# EAGLE design rear-port-power (EAGLE 9.7.0)
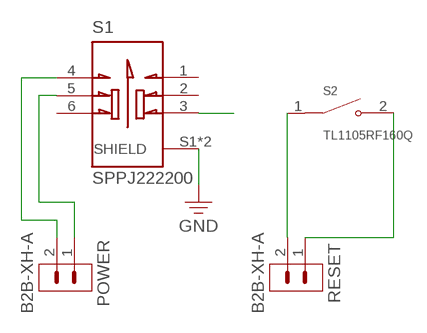
[diagram p0: schematic, sheet 1]

## Parts
POWER  B2B-XH-A  [B2B-XH-A]
RESET  B2B-XH-A  [B2B-XH-A]
S1  SPPJ222200  [SW_SPPJ222200]
S2  TL1105RF160Q  [SW_TL1105RF160Q]

## Nets
GND: S1.S1(SHIELD) S1.S2(SHIELD)
N$1: S1.3
N$2: POWER.2 S1.4
N$3: POWER.1 S1.5
N$4: RESET.2 S2.1
N$5: RESET.1 S2.2
Unconnected: S1.1 S1.2 S1.6

## Library data of the parts
POWER RESET = Connector:B2B-XH-A: XH Connector Top Entry - 2POS Reference: : Datasheet <http://www.jst-mfg.com/product/pdf/eng/eXH.pdf>; CATEGORY: Connectors; DATASHEET: https://www.jst-mfg.com/product/pdf/eng/eXH.pdf; DESCRIPTION: Connector Header Through Hole 2 position 0.098" (2.50mm); MANUFACTURER: JST Sales America Inc.; MPN: B2B-XH-A; OPERATING_TEMPERATURE: -25°C ~ 85°C; PACKAGE_SIZE: NA; PACKAGE_TYPE: Through Hole; PART_STATUS: Active; PITCH: 0.098" (2.50mm); ROHS: Compliant; SERIES: XH; SUBCATEGORY: Rectangular Connectors; TYPE: Male Headers
S1 = SPPJ222200:SPPJ222200: Check availability <https://pricing.snapeda.com/parts/SPPJ222200/ALPS/view-part?ref=eda>; AVAILABILITY: In Stock; CHECK_PRICES: https://www.snapeda.com/parts/SPPJ222200/ALPS/view-part/?ref=eda; DESCRIPTION: Switch Push Button N.O./N.C. DPDT Plunger 0.2A 30VDC Latching PC Pins Bracket Mount/Through Hole Bulk; MF: ALPS; MP: SPPJ222200; PACKAGE: None; PRICE: None; SNAPEDA_LINK: https://www.snapeda.com/parts/SPPJ222200/ALPS/view-part/?ref=snap
S2 = SW_TL1105RF160Q:TL1105RF160Q: Check availability <https://pricing.snapeda.com/parts/TL1105RF160Q/E-Switch/view-part?ref=eda>; AVAILABILITY: In Stock; CHECK_PRICES: https://www.snapeda.com/parts/TL1105RF160Q/E-Switch/view-part/?ref=eda; DESCRIPTION: Tactile Switch, TL1105 Series, SPST-NO, 6.15mm Side Actuated, 0.05A, 12VDC, PC | E-Switch TL1105RF160Q; MF: E-Switch; MP: TL1105RF160Q; PACKAGE: None; PRICE: None; SNAPEDA_LINK: https://www.snapeda.com/parts/TL1105RF160Q/E-Switch/view-part/?ref=snap

## Board
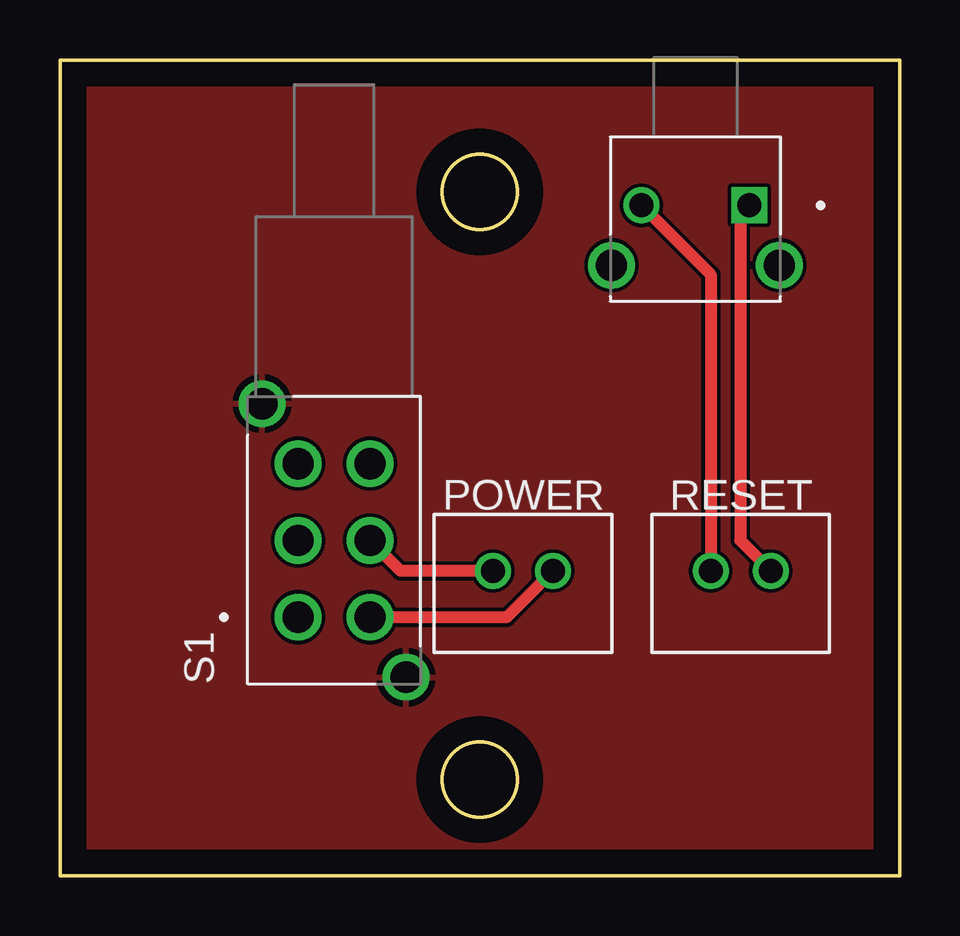
[diagram p1: board, top side]
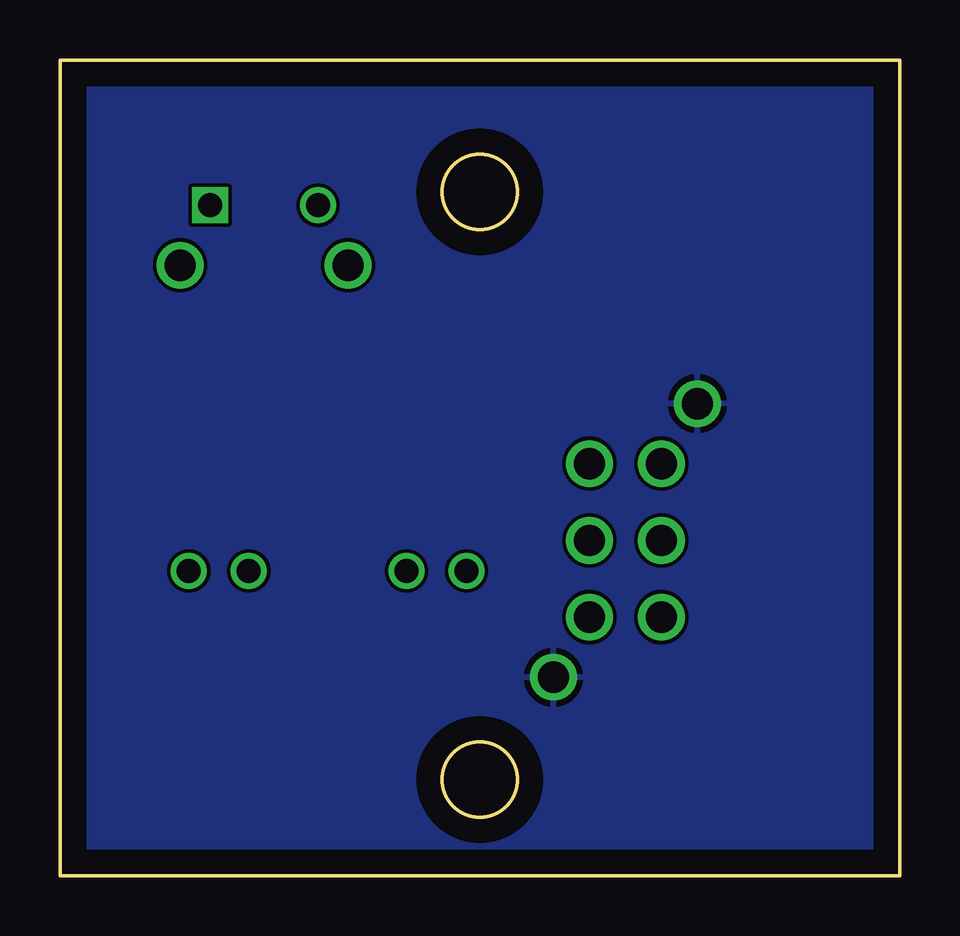
[diagram p2: board, bottom side, seen from below]

Size 35 x 34 mm. Coordinates in mm from the lower left corner, seen from the top.
Outline: 35,34 0,34 0,0 35,0 35,34
Outline: circle at 17.5,4 radius 1.55
Outline: circle at 17.5,28.5 radius 1.55
Copper layers (1*16): Top 0.035mm / dielectric 1.5mm / Bottom 0.035mm
Design rules "Fusion Electronics Design Rules *": minimum track width 6mil, minimum drill 0.35mm, track to track 6mil, track to pad 6mil, pad to pad 6mil, via to via 6mil, smd to smd 6mil, copper to edge 40mil, drill to drill 6mil, minimum pad ring 6mil, minimum via ring 8mil, stop-mask expansion 6mil, vias tented up to drill 9999mil, thermal gap 10mil

### Footprints (pad centres in the part's own frame; a part is rotated, then mirrored left to right if it is on the bottom)
B2B-XH-A = drill 1: 1 0,0; 2 2.5,0
SW_SPPJ222200 = drill 1.3: 1 -3.2,1.5; 2 0,1.5; 3 3.2,1.5; 4 -3.2,-1.5; 5 0,-1.5; 6 3.2,-1.5; S1 -5.7,-3; S2 5.7,3
SW_TL1105RF160Q = drill 1 square: 1 -2.25,0 | drill 1: 2 2.25,0 | drill 1.3: SH1 -3.5,2.5; SH2 3.5,2.5

### Placement (x,y rotation side)
POWER  18.05,12.7 0 top
RESET  27.13,12.7 0 top
S1  11.43,13.97 90 top
S2  26.49,27.94 180 top

### Tracks (layer width: path | path; a pad name or v marks a point on that pad's centre or on a via)
GND
  pour Top: -1.19,-1.19 264.08,-1.19 264.08,40.56 -1.19,40.56
  pour Bottom: -1.19,-1.19 264.08,-1.19 264.08,40.56 -1.19,40.56
N$2
  Top 0.508: POWER.2 18.62,10.77 S1.4
N$3
  Top 0.508: POWER.1 14.2,12.7 S1.5
N$4
  Top 0.508: S2.1 28.36,27.56 28.36,13.97 RESET.2
N$5
  Top 0.508: S2.2 27.13,25.05 RESET.1